# Altium schematic sheet MCU.SchDoc: =DT_SCH_Title
size A3; Organization: Droid Technologies; SheetNumber: 3; SheetTotal: 20
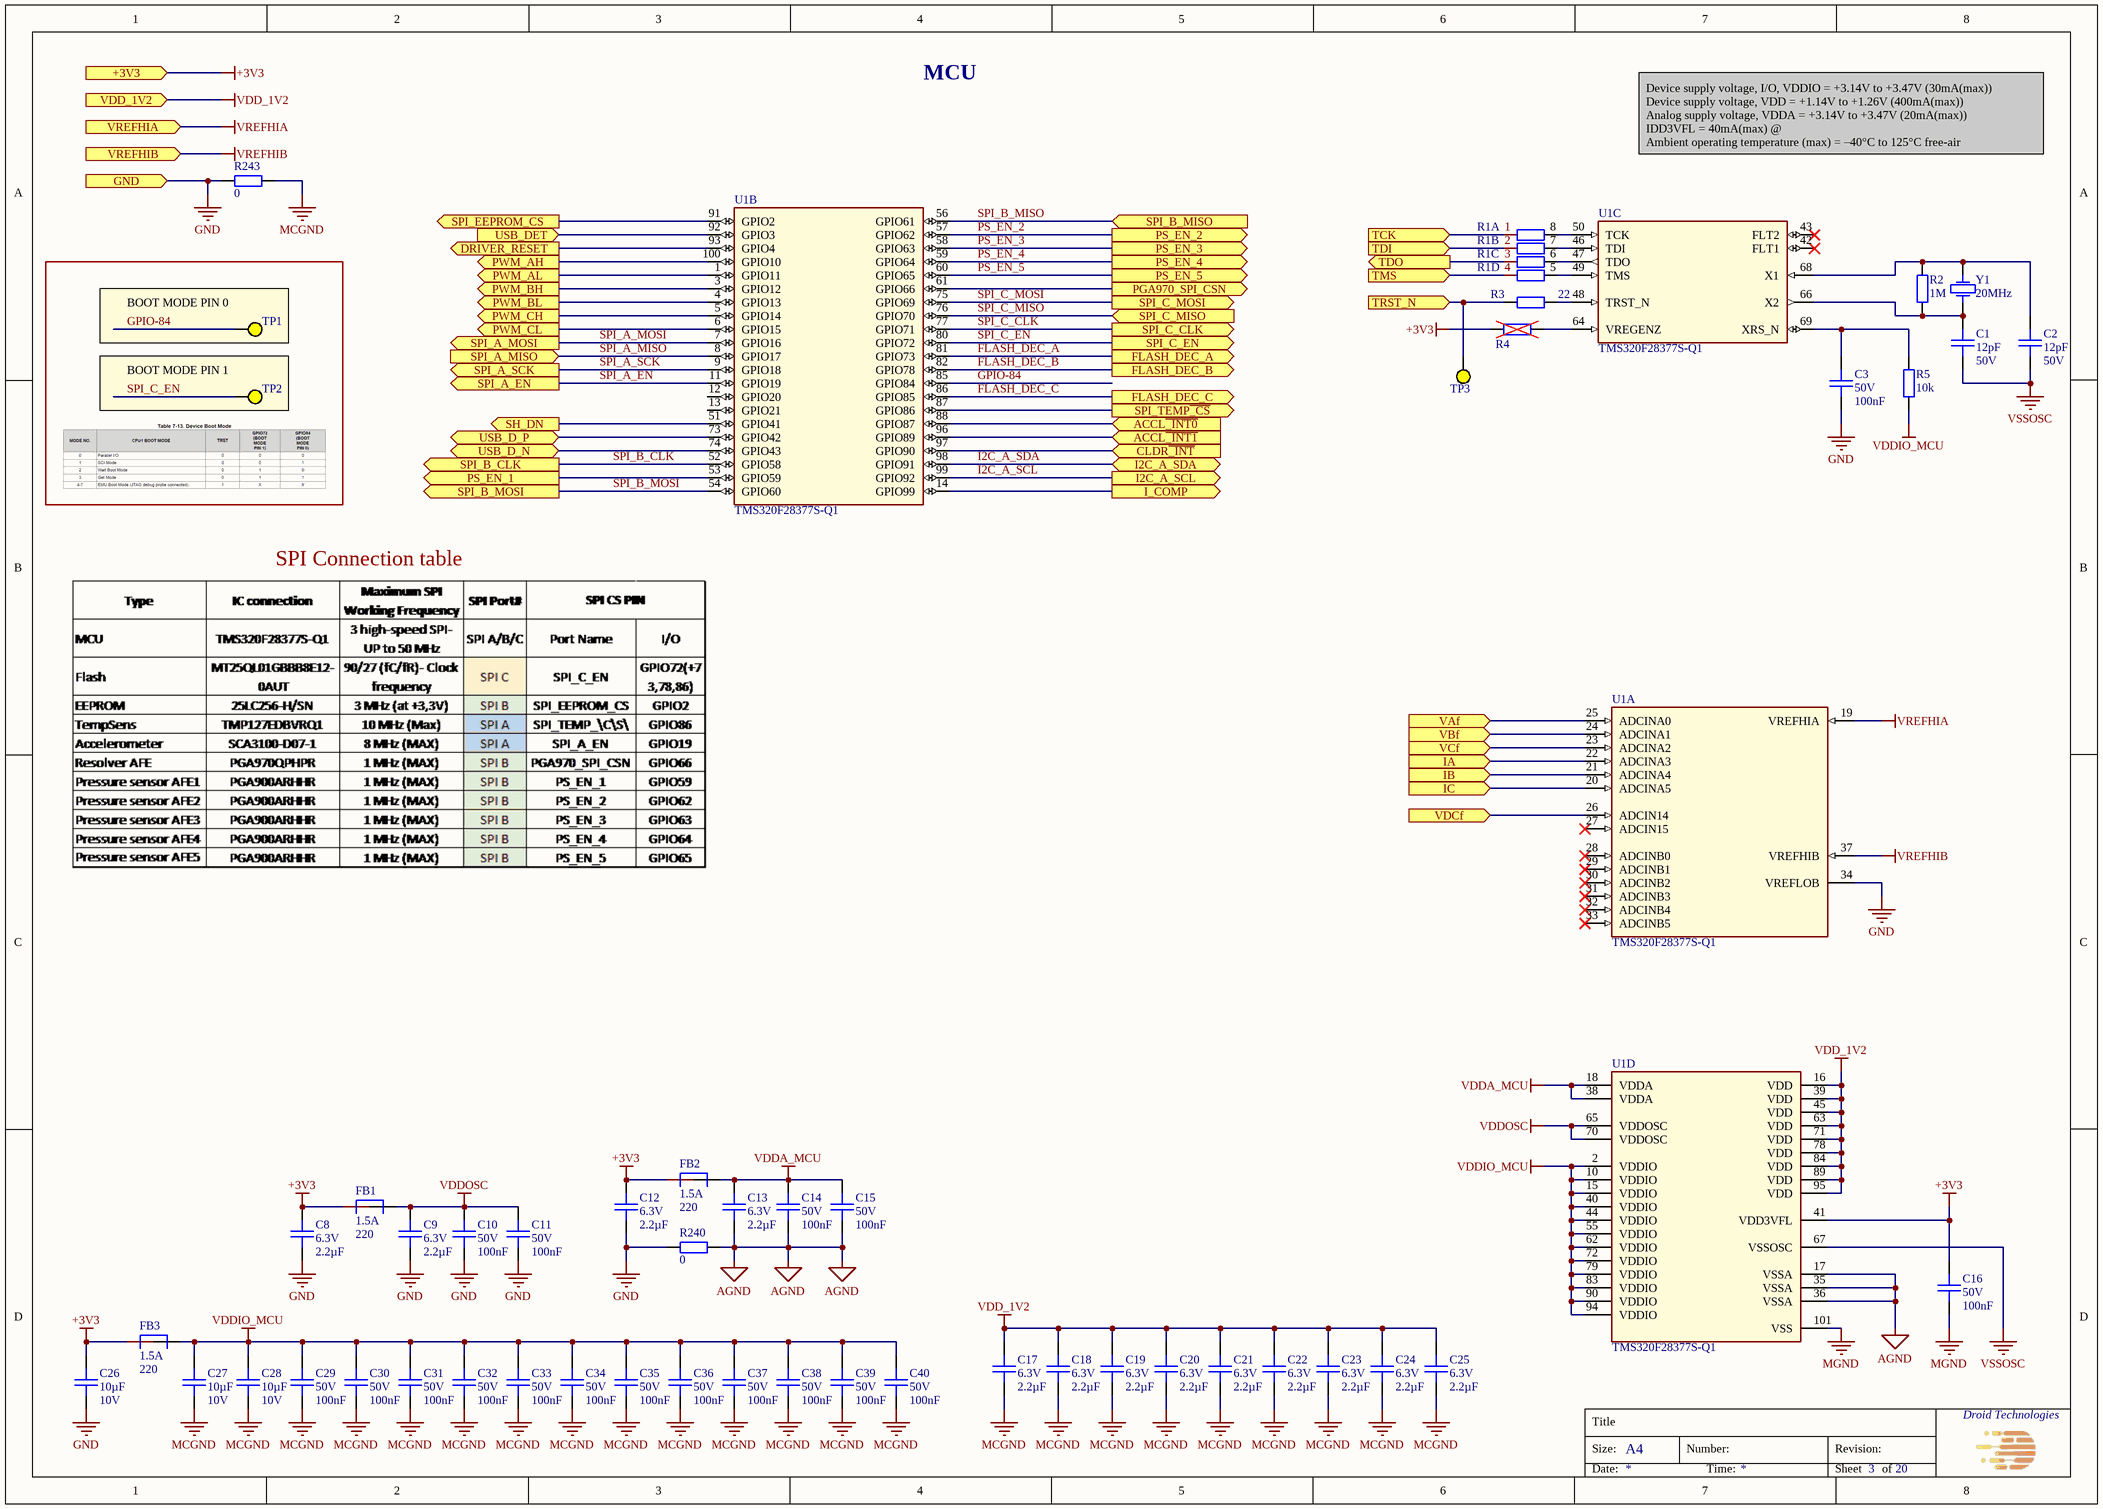
[diagram p0: MCU.SchDoc]

## Parts
C1  Capacitance: 12pF  Voltage Rating: 50V  [CAPC100x50x50L25]  (hidden comment: C0402C120J5HACAUTO)
C2  Capacitance: 12pF  Voltage Rating: 50V  [CAPC100x50x50L25]  (hidden comment: C0402C120J5HACAUTO)
C3  Voltage Rating: 50V  Capacitance: 100nF  [CAPC100x50x50L25]  (hidden comment: GCM155L8EH104KE07D)
C8  Voltage Rating: 6.3V  Capacitance: 2.2µF  [CAPC160X80X90L35]  (hidden comment: C1608X8L0J225K080AC)
C9  Voltage Rating: 6.3V  Capacitance: 2.2µF  [CAPC160X80X90L35]  (hidden comment: C1608X8L0J225K080AC)
C10  Voltage Rating: 50V  Capacitance: 100nF  [CAPC100x50x50L25]  (hidden comment: GCM155L8EH104KE07D)
C11  Voltage Rating: 50V  Capacitance: 100nF  [CAPC100x50x50L25]  (hidden comment: GCM155L8EH104KE07D)
C12  Voltage Rating: 6.3V  Capacitance: 2.2µF  [CAPC160X80X90L35]  (hidden comment: C1608X8L0J225K080AC)
C13  Voltage Rating: 6.3V  Capacitance: 2.2µF  [CAPC160X80X90L35]  (hidden comment: C1608X8L0J225K080AC)
C14  Voltage Rating: 50V  Capacitance: 100nF  [CAPC100x50x50L25]  (hidden comment: GCM155L8EH104KE07D)
C15  Voltage Rating: 50V  Capacitance: 100nF  [CAPC100x50x50L25]  (hidden comment: GCM155L8EH104KE07D)
C16  Voltage Rating: 50V  Capacitance: 100nF  [CAPC100x50x50L25]  (hidden comment: GCM155L8EH104KE07D)
C17  Voltage Rating: 6.3V  Capacitance: 2.2µF  [CAPC160X80X90L35]  (hidden comment: C1608X8L0J225K080AC)
C18  Voltage Rating: 6.3V  Capacitance: 2.2µF  [CAPC160X80X90L35]  (hidden comment: C1608X8L0J225K080AC)
C19  Voltage Rating: 6.3V  Capacitance: 2.2µF  [CAPC160X80X90L35]  (hidden comment: C1608X8L0J225K080AC)
C20  Voltage Rating: 6.3V  Capacitance: 2.2µF  [CAPC160X80X90L35]  (hidden comment: C1608X8L0J225K080AC)
C21  Voltage Rating: 6.3V  Capacitance: 2.2µF  [CAPC160X80X90L35]  (hidden comment: C1608X8L0J225K080AC)
C22  Voltage Rating: 6.3V  Capacitance: 2.2µF  [CAPC160X80X90L35]  (hidden comment: C1608X8L0J225K080AC)
C23  Voltage Rating: 6.3V  Capacitance: 2.2µF  [CAPC160X80X90L35]  (hidden comment: C1608X8L0J225K080AC)
C24  Voltage Rating: 6.3V  Capacitance: 2.2µF  [CAPC160X80X90L35]  (hidden comment: C1608X8L0J225K080AC)
C25  Voltage Rating: 6.3V  Capacitance: 2.2µF  [CAPC160X80X90L35]  (hidden comment: C1608X8L0J225K080AC)
C26  Capacitance: 10µF  Voltage Rating: 10V  [CAPC200X125X145L50]  (hidden comment: CGA4J1X8L1A106K125AC)
C27  Capacitance: 10µF  Voltage Rating: 10V  [CAPC200X125X145L50]  (hidden comment: CGA4J1X8L1A106K125AC)
C28  Capacitance: 10µF  Voltage Rating: 10V  [CAPC200X125X145L50]  (hidden comment: CGA4J1X8L1A106K125AC)
C29  Voltage Rating: 50V  Capacitance: 100nF  [CAPC100x50x50L25]  (hidden comment: GCM155L8EH104KE07D)
C30  Voltage Rating: 50V  Capacitance: 100nF  [CAPC100x50x50L25]  (hidden comment: GCM155L8EH104KE07D)
C31  Voltage Rating: 50V  Capacitance: 100nF  [CAPC100x50x50L25]  (hidden comment: GCM155L8EH104KE07D)
C32  Voltage Rating: 50V  Capacitance: 100nF  [CAPC100x50x50L25]  (hidden comment: GCM155L8EH104KE07D)
C33  Voltage Rating: 50V  Capacitance: 100nF  [CAPC100x50x50L25]  (hidden comment: GCM155L8EH104KE07D)
C34  Voltage Rating: 50V  Capacitance: 100nF  [CAPC100x50x50L25]  (hidden comment: GCM155L8EH104KE07D)
C35  Voltage Rating: 50V  Capacitance: 100nF  [CAPC100x50x50L25]  (hidden comment: GCM155L8EH104KE07D)
C36  Voltage Rating: 50V  Capacitance: 100nF  [CAPC100x50x50L25]  (hidden comment: GCM155L8EH104KE07D)
C37  Voltage Rating: 50V  Capacitance: 100nF  [CAPC100x50x50L25]  (hidden comment: GCM155L8EH104KE07D)
C38  Voltage Rating: 50V  Capacitance: 100nF  [CAPC100x50x50L25]  (hidden comment: GCM155L8EH104KE07D)
C39  Voltage Rating: 50V  Capacitance: 100nF  [CAPC100x50x50L25]  (hidden comment: GCM155L8EH104KE07D)
C40  Voltage Rating: 50V  Capacitance: 100nF  [CAPC100x50x50L25]  (hidden comment: GCM155L8EH104KE07D)
FB1  Imax: 1.5A  Impedance: 220  [BEADC160X80X95L40]  (hidden comment: BLM18KG221BH1D)
FB2  Imax: 1.5A  Impedance: 220  [BEADC160X80X95L40]  (hidden comment: BLM18KG221BH1D)
FB3  Imax: 1.5A  Impedance: 220  [BEADC160X80X95L40]  (hidden comment: BLM18KG221BH1D)
R1  EXB-N8V220JX  [RESCAV8P50_200X100X55L30X30]  (value not drawn)  (parts A,B,C,D of 4)
R2  Resistance: 1M  [RESC100X50X40L25]  (hidden comment: RC0402FR-071ML)
R3  Resistance: 22  [RESC100X50X40L25]  (hidden comment: RC0402FR-0722RL)
R4  DNP chip res 0603  [RESC160X80X55L30]  (value not drawn)
R5  Resistance: 10k  [RESC100X50X40L25]  (hidden comment: RC0402FR-0710KL)
R240  Resistance: 0  [RESC160X80X55L30]  (hidden comment: RC0603FR-070RL)
R243  Resistance: 0  [RESC160X80X55L30]  (hidden comment: RC0603FR-070RL)
TP1  Test Point  [TP_D1.5mm]  (value not drawn)  (no BOM)
TP2  Test Point  [TP_D1.5mm]  (value not drawn)  (no BOM)
TP3  Test Point  [TP_D0.75mm]  (value not drawn)
U1  TMS320F28377S-Q1  [100-HTQFP (14x14)]  (parts A,B,C,D of 4)
Y1  20MHz  [NX5032GA]

## Blocks framed on the sheet
BOOT MODE PIN 0: TP1
BOOT MODE PIN 1: TP2

## Ports
+3V3 (in), ACCL~{_INT0} (in), ACCL~{_INT1} (in), CLDR~{_INT} (in), DRIVER_RESET (out), FLASH_DEC_A (out), FLASH_DEC_B (out), FLASH_DEC_C (out), GND (in), I2C_A_SCL (out), I2C_A_SDA (bidir), I_COMP (out), IA (in), IB (in), IC (in), PGA970_SPI_CSN (out), PS_EN_1 (out), PS_EN_2 (out), PS_EN_3 (out), PS_EN_4 (out), PS_EN_5 (out), PWM_AH (out), PWM_AL (out), PWM_BH (out), PWM_BL (out), PWM_CH (out), PWM_CL (out), SH_DN (out), SPI_A_EN (out), SPI_A_MISO (in), SPI_A_MOSI (out), SPI_A_SCK (out), SPI_B_CLK (out), SPI_B_MISO (in), SPI_B_MOSI (out), SPI_C_CLK (out), SPI_C_EN (out), SPI_C_MISO (in), SPI_C_MOSI (out), SPI_EEPROM_CS (out), SPI_TEMP~{_CS} (out), TCK (in), TDI (in), TDO (out), TMS (in), TRST_N (in), USB_D_N (bidir), USB_D_P (bidir), USB_DET (in), VAf (in), VBf (in), VCf (in), VDCf (in), VDD_1V2 (in), VREFHIA (in), VREFHIB (in)

## Nets
+3V3: C8.2 C12.2 C16.2 C26.2 FB1.1 FB2.1 FB3.1 R4.2 U1.41(VDD3VFL) ; port +3V3
AGND: C13.1 C14.1 C15.1 R240.1 U1.17(VSSA) U1.35(VSSA) U1.36(VSSA)
GND: C3.1 C8.1 C9.1 C10.1 C11.1 C12.1 C26.1 R240.2 R243.2 U1.34(VREFLOB) ; port GND
MCGND: C17.1 C18.1 C19.1 C20.1 C21.1 C22.1 C23.1 C24.1 C25.1 C27.1 C28.1 C29.1 C30.1 C31.1 C32.1 C33.1 C34.1 C35.1 C36.1 C37.1 C38.1 C39.1 C40.1 R243.1
MGND: C16.1 U1.101(VSS)
VDD_1V2: C17.2 C18.2 C19.2 C20.2 C21.2 C22.2 C23.2 C24.2 C25.2 U1.16(VDD) U1.39(VDD) U1.45(VDD) U1.63(VDD) U1.71(VDD) U1.78(VDD) U1.84(VDD) U1.89(VDD) U1.95(VDD) ; port VDD_1V2
VDDA_MCU: C13.2 C14.2 C15.2 FB2.2 U1.18(VDDA) U1.38(VDDA)
VDDIO_MCU: C27.2 C28.2 C29.2 C30.2 C31.2 C32.2 C33.2 C34.2 C35.2 C36.2 C37.2 C38.2 C39.2 C40.2 FB3.2 R5.1 U1.2(VDDIO) U1.10(VDDIO) U1.15(VDDIO) U1.40(VDDIO) U1.44(VDDIO) U1.55(VDDIO) U1.62(VDDIO) U1.72(VDDIO) U1.79(VDDIO) U1.83(VDDIO) U1.90(VDDIO) U1.94(VDDIO)
VDDOSC: C9.2 C10.2 C11.2 FB1.2 U1.65(VDDOSC) U1.70(VDDOSC)
VREFHIA: U1.19(VREFHIA) ; port VREFHIA
VREFHIB: U1.37(VREFHIB) ; port VREFHIB
VSSOSC: C1.2 C2.2 U1.67(VSSOSC)
ACCL~{_INT0}: U1.88(GPIO87) ; port ACCL~{_INT0}
ACCL~{_INT1}: U1.96(GPIO89) ; port ACCL~{_INT1}
CLDR~{_INT}: U1.97(GPIO90) ; port CLDR~{_INT}
DRIVER_RESET: U1.93(GPIO4) ; port DRIVER_RESET
FLASH_DEC_A: U1.81(GPIO73) ; port FLASH_DEC_A
FLASH_DEC_B: U1.82(GPIO78) ; port FLASH_DEC_B
FLASH_DEC_C: U1.86(GPIO85) ; port FLASH_DEC_C
GPIO-84: TP1.1 U1.85(GPIO84)
I2C_A_SCL: U1.99(GPIO92) ; port I2C_A_SCL
I2C_A_SDA: U1.98(GPIO91) ; port I2C_A_SDA
I_COMP: U1.14(GPIO99) ; port I_COMP
IA: U1.22(ADCINA3) ; port IA
IB: U1.21(ADCINA4) ; port IB
IC: U1.20(ADCINA5) ; port IC
PGA970_SPI_CSN: U1.61(GPIO66) ; port PGA970_SPI_CSN
PS_EN_1: U1.53(GPIO59) ; port PS_EN_1
PS_EN_2: U1.57(GPIO62) ; port PS_EN_2
PS_EN_3: U1.58(GPIO63) ; port PS_EN_3
PS_EN_4: U1.59(GPIO64) ; port PS_EN_4
PS_EN_5: U1.60(GPIO65) ; port PS_EN_5
PWM_AH: U1.100(GPIO10) ; port PWM_AH
PWM_AL: U1.1(GPIO11) ; port PWM_AL
PWM_BH: U1.3(GPIO12) ; port PWM_BH
PWM_BL: U1.4(GPIO13) ; port PWM_BL
PWM_CH: U1.5(GPIO14) ; port PWM_CH
PWM_CL: U1.6(GPIO15) ; port PWM_CL
SH_DN: U1.51(GPIO41) ; port SH_DN
SPI_A_EN: U1.11(GPIO19) ; port SPI_A_EN
SPI_A_MISO: U1.8(GPIO17) ; port SPI_A_MISO
SPI_A_MOSI: U1.7(GPIO16) ; port SPI_A_MOSI
SPI_A_SCK: U1.9(GPIO18) ; port SPI_A_SCK
SPI_B_CLK: U1.52(GPIO58) ; port SPI_B_CLK
SPI_B_MISO: U1.56(GPIO61) ; port SPI_B_MISO
SPI_B_MOSI: U1.54(GPIO60) ; port SPI_B_MOSI
SPI_C_CLK: U1.77(GPIO71) ; port SPI_C_CLK
SPI_C_EN: TP2.1 U1.80(GPIO72) ; port SPI_C_EN
SPI_C_MISO: U1.76(GPIO70) ; port SPI_C_MISO
SPI_C_MOSI: U1.75(GPIO69) ; port SPI_C_MOSI
SPI_EEPROM_CS: U1.91(GPIO2) ; port SPI_EEPROM_CS
SPI_TEMP~{_CS}: U1.87(GPIO86) ; port SPI_TEMP~{_CS}
TCK: R1.1 ; port TCK
TDI: R1.2 ; port TDI
TDO: R1.3 ; port TDO
TMS: R1.4 ; port TMS
TRST_N: R3.1 TP3.1 ; port TRST_N
USB_D_N: U1.74(GPIO43) ; port USB_D_N
USB_D_P: U1.73(GPIO42) ; port USB_D_P
USB_DET: U1.92(GPIO3) ; port USB_DET
VAf: U1.25(ADCINA0) ; port VAf
VBf: U1.24(ADCINA1) ; port VBf
VCf: U1.23(ADCINA2) ; port VCf
VDCf: U1.26(ADCIN14) ; port VDCf
NetC1_1: C1.1 R2.1 U1.66(X2) Y1.1
NetC2_1: C2.1 R2.2 U1.68(X1) Y1.2
NetC3_2: C3.2 R5.2 U1.69(XRS_N)
NetR1_5: R1.5 U1.49(TMS)
NetR1_6: R1.6 U1.47(TDO)
NetR1_7: R1.7 U1.46(TDI)
NetR1_8: R1.8 U1.50(TCK)
NetR3_2: R3.2 U1.48(TRST_N)
NetR4_1: R4.1 U1.64(VREGENZ)

Not connected (* = marked no-connect by the designer): U1 12(GPIO20) 13(GPIO21) 27(ADCIN15)* 28(ADCINB0)* 29(ADCINB1)* 30(ADCINB2)* 31(ADCINB3)* 32(ADCINB4)* 33(ADCINB5)* 42(FLT1)* 43(FLT2)*

## Notes on the sheet
- MCU
- Device supply voltage, I/O, VDDIO = +3.14V to +3.47V (30mA(max))
  Device supply voltage, VDD = +1.14V to +1.26V (400mA(max))
  Analog supply voltage, VDDA = +3.14V to +3.47V (20mA(max))
  IDD3VFL = 40mA(max) @
  Ambient operating temperature (max) = –40°C to 125°C free-air
- SPI Connection table
- Title
- Size:
- A4
- Number:
- Revision:
- Date:
- Time:
- Sheet
- of

## Library data of the parts
C1 C2 = CMP-001-2042-2: CAP CER 0402 12PF 50V ULTRA STAB; Manufacturer: KEMET; Tolerance: 5%; Op Temp min: -55°C; Dielectric: X8R; Op Temp max: 150°C; ComponentLink3URL: https://www.digikey.com/en/products/detail/kemet/C0402C120J5HACAUTO/7955501; ComponentLink1Description: Datasheet; ComponentLink2URL: https://eu.mouser.com/ProductDetail/KEMET/C0402C120J5HACAUTO?qs=j%252B1pi9TdxUZTSOjjZ2f5wA%3D%3D; Size: 1.00mm x 0.50mm; ComponentLink2Description: Mouser; Ratings: AEC-Q200; ComponentLink3Description: Digikey; Mounting Type: SM; Lead Spacing: 0mm; MPN: C0402C120J5HACAUTO; ComponentLink1URL: https://search.kemet.com/component-documentation/download/specsheet/C0402C120J5HACAUTO; Height max: 550µm; Package: 0402 (1005 Metric)
C3 C10 C11 C14-C16 C29-C40 = CMP-001-1980-2: CAP CER 0.1UF 50V X8L 0402; Manufacturer: Murata Electronics; Op Temp max: 150°C; Op Temp min: -55°C; Tolerance: 10%; Height max: 550µm; ComponentLink3Description: Digikey; Mounting Type: SM; ComponentLink3URL: https://www.digikey.com/en/products/detail/murata-electronics/GCM155L8EH104KE07D/11618823; Package: 0402 (1005 Metric); Lead Spacing: 0mm; MPN: GCM155L8EH104KE07D; Size: 1.00mm x 0.50mm; Ratings: AEC-Q200; ComponentLink1URL: https://www.murata.com/en-us/products/productdetail?partno=GCM155L8EH104KE07%23; ComponentLink1Description: Datasheet; Dielectric: X8L; ComponentLink2Description: Mouser; ComponentLink2URL: https://eu.mouser.com/ProductDetail/Murata-Electronics/GCM155L8EH104KE07D?qs=1mbolxNpo8fQSHf0HYnZWw%3D%3D
C8 C9 C12 C13 C17-C25 = CMP-001-2044-2: CAP CER 2.2UF 6.3V X8L 0603; Manufacturer: TDK Corporation; Op Temp min: -55°C; Tolerance: 10%; Op Temp max: 150°C; ComponentLink1URL: https://product.tdk.com/en/search/capacitor/ceramic/mlcc/info?part_no=C1608X8L0J225K080AC; MPN: C1608X8L0J225K080AC; ComponentLink3URL: https://www.digikey.com/en/products/detail/tdk-corporation/C1608X8L0J225K080AC/8343784; ComponentLink1Description: Datasheet; Lead Spacing: 0mm; ComponentLink3Description: Digikey; Package: 0603 (1608 Metric); Height max: 900µm; Size: 1.60mm x 0.80mm; Dielectric: X8L; Ratings: -; Mounting Type: SM; ComponentLink2URL: https://eu.mouser.com/ProductDetail/TDK/C1608X8L0J225K080AC?qs=rrS6PyfT74dgREMaiAoT3Q%3D%3D; ComponentLink2Description: Mouser
C26-C28 = CMP-001-1984-2: CAP CER 10UF 10V X8L 0805; Manufacturer: TDK Corporation; Tolerance: 10%; Op Temp min: -55°C; Op Temp max: 150°C; ComponentLink3Description: Digikey; Mounting Type: SM; Ratings: AEC-Q200; ComponentLink1Description: Datasheet; ComponentLink3URL: https://www.digikey.com/en/products/detail/tdk-corporation/CGA4J1X8L1A106K125AC/9991388; Lead Spacing: 0mm; MPN: CGA4J1X8L1A106K125AC; Size: 2.00mm x 1.25mm; Height max: 1.5mm; ComponentLink2URL: https://eu.mouser.com/ProductDetail/TDK/CGA4J1X8L1A106K125AC?qs=gZXFycFWdANzH%252B2UvJJjtQ%3D%3D; Package: 0805 (2012 Metric); ComponentLink2Description: Mouser; Dielectric: X8L; ComponentLink1URL: https://product.tdk.com/en/search/capacitor/ceramic/mlcc/info?part_no=CGA4J1X8L1A106K125AC
FB1-FB3 = CMP-001-1981-1: FERRITE BEAD 220 OHM 0603 1LN; Manufacturer: Murata Electronics; DCR: 50m; Op Temp min: -55°C; Frequency: 100MHz; Op Temp max: 150°C; Number of Lines: 1; Mounting Type: SM; Size: 1.60mm x 0.80mm; ComponentLink2URL: https://eu.mouser.com/ProductDetail/Murata-Electronics/BLM18KG221BH1D?qs=sJ5gq5MLFXpgEHYBdWUtkQ%3D%3D; ComponentLink1Description: Datasheet; ComponentLink1URL: https://www.murata.com/en-us/products/productdata/8798137286686/QNFA9129.pdf; Lead Spacing: 0mm; Ratings: AEC-Q200; ComponentLink3Description: Digikey; ComponentLink3URL: https://www.digikey.com/en/products/detail/murata-electronics/BLM18KG221BH1D/6156000; Height max: 950µm; Package: 0603 (1608 Metric); ComponentLink2Description: Mouser; MPN: BLM18KG221BH1D
R1 = CMP-001-1215-2: RES ARRAY 4 RES 22 OHM 0804; Manufacturer: Panasonic Electronic Components; Temperature Coefficient: ±200ppm; Number of Resistors: 4; Tolerance: 5%; Op Temp min: -55°C; Power Per Element: 31mW; Op Temp max: 125°C; Resistance: 22; Ratings: -; ComponentLink2Description: Mouser; ComponentLink1Description: Datasheet; Number of Pins: 8; Size: 2.00mm x 1.00mm; ComponentLink3Description: Digikey; Height max: 550µm; ComponentLink2URL: https://eu.mouser.com/ProductDetail/Panasonic/EXB-N8V220JX?qs=bx0%2FPCyAc7556mtSQRzOoA%3D%3D; Resistor-Ratio-Drift: -; ComponentLink1URL: https://industrial.panasonic.com/cdbs/www-data/pdf/AOC0000/AOC0000C14.pdf; Package: 0804, Concave, Long Side Terminals; ComponentLink3URL: https://www.digikey.com/en/products/detail/panasonic-electronic-components/EXB-N8V220JX/671714; Resistor Matching Ratio: -; MPN: EXB-N8V220JX; Mounting Type: SM
R2 = CMP-00539-4: RES 1M OHM 1% 1/16W 0402; Manufacturer: YAGEO; Op Temp max: 155°C; Op Temp min: -55°C; Temperature Coefficient: ±100ppm; Power: 63mW; Ratings: -; ComponentLink2URL: https://eu.mouser.com/ProductDetail/YAGEO/RC0402FR-071ML?qs=V1yeUXFNrknfoI4987wfBQ%3D%3D; Height max: 400µm; ComponentLink1Description: Datasheet; Mounting Type: SM; ComponentLink2Description: Mouser; Package: 0402 (1005 Metric); ComponentLink3URL: https://www.digikey.com/en/products/detail/yageo/RC0402FR-071ML/726515; MPN: RC0402FR-071ML; Tolerance: 1%; ComponentLink1URL: https://www.yageo.com/upload/media/product/productsearch/datasheet/rchip/PYu-RC_Group_51_RoHS_L_12.pdf; Composition: Thick Film; Size: 1.00mm x 0.50mm; ComponentLink3Description: Digikey
R3 = CMP-001-0482-4: RES 22 OHM 1% 1/16W 0402; Manufacturer: YAGEO; Temperature Coefficient: ±100ppm; Op Temp max: 155°C; Op Temp min: -55°C; Power: 63mW; Ratings: -; ComponentLink3URL: https://www.digikey.com/en/products/detail/yageo/RC0402FR-0722RL/726562; ComponentLink2URL: https://eu.mouser.com/ProductDetail/YAGEO/RC0402FR-0722RL?qs=V1yeUXFNrkkRg6zf08ADKQ%3D%3D; MPN: RC0402FR-0722RL; ComponentLink1Description: Datasheet; ComponentLink3Description: Digikey; Tolerance: 1%; Size: 1.00mm x 0.50mm; ComponentLink1URL: https://www.yageo.com/upload/media/product/productsearch/datasheet/rchip/PYu-RC_Group_51_RoHS_L_12.pdf; Composition: Thick Film; ComponentLink2Description: Mouser; Mounting Type: SM; Package: 0402 (1005 Metric); Height max: 400µm
R4 = CMP-001-0920-3: DNP res 0603; Mounting Type: SM; MPN: DNP; Package: 0603 (1608 Metric)
R5 = CMP-00010-6: RES 10K OHM 1% 1/16W 0402; Manufacturer: YAGEO; Op Temp max: 155°C; Op Temp min: -55°C; Power: 63mW; Temperature Coefficient: ±100ppm; ComponentLink3URL: https://www.digikey.com/en/products/detail/yageo/RC0402FR-0710KL/726523; ComponentLink1Description: Datasheet; Height max: 400µm; ComponentLink3Description: Digikey; ComponentLink2URL: https://www2.mouser.com/ProductDetail/YAGEO/RC0402FR-0710KL?qs=%2Fha2pyFaduhjtLcYvKXQ8NAGbRXkQ%2Fwl6RsvWHeV66MSeqLhkcF3rg%3D%3D; Ratings: -; MPN: RC0402FR-0710KL; ComponentLink1URL: https://www.yageo.com/upload/media/product/productsearch/datasheet/rchip/PYu-RC_Group_51_RoHS_L_12.pdf; ComponentLink2Description: Mouser; Mounting Type: SM; Tolerance: 1%; Composition: Thick Film; Size: 1.00mm x 0.50mm; Package: 0402 (1005 Metric)
R240 R243 = CMP-001-0927-2: RES 0 OHM JUMPER 1/10W 0603; Manufacturer: YAGEO; Op Temp min: -55°C; Op Temp max: 155°C; Power: 100mW; Tolerance: 0%; Height max: 550µm; ComponentLink2URL: https://eu.mouser.com/ProductDetail/YAGEO/RC0603FR-070RL?qs=0yPvnVz5%2FmpDQv43TwvCfw%3D%3D; Temperature Coefficient: -; ComponentLink3Description: Digikey; ComponentLink2Description: Mouser; MPN: RC0603FR-070RL; ComponentLink1URL: https://www.yageo.com/upload/media/product/productsearch/datasheet/rchip/PYu-RC_Group_51_RoHS_L_12.pdf; Ratings: -; Size: 1.60mm x 0.80mm; Composition: Thick Film; Mounting Type: SM; ComponentLink3URL: https://www.digikey.com/en/products/detail/yageo/RC0603FR-070RL/1304008; Package: 0603 (1608 Metric); ComponentLink1Description: Datasheet
TP1 TP2 = TP_1.5
TP3 = TP_0.75: Test point 0.75mm
U1 = TMS320F28377SPZPQ: IC MCU 32BIT 1MB FLASH 100HTQFP; Manufacturer: Texas Instruments; MPN: TMS320F28377SPZPQ
Y1 = STDCSU2-20M: CRYSTAL 20.0000MHZ 8PF SMD; Manufacturer: NDK (NIHON DEMPA KOGYO CO., LTD); MPN: STDCSU2-20M